# EAGLE design SmartTraffic_Shield_UNO_R3_Baquelita (EAGLE 9.3.1)
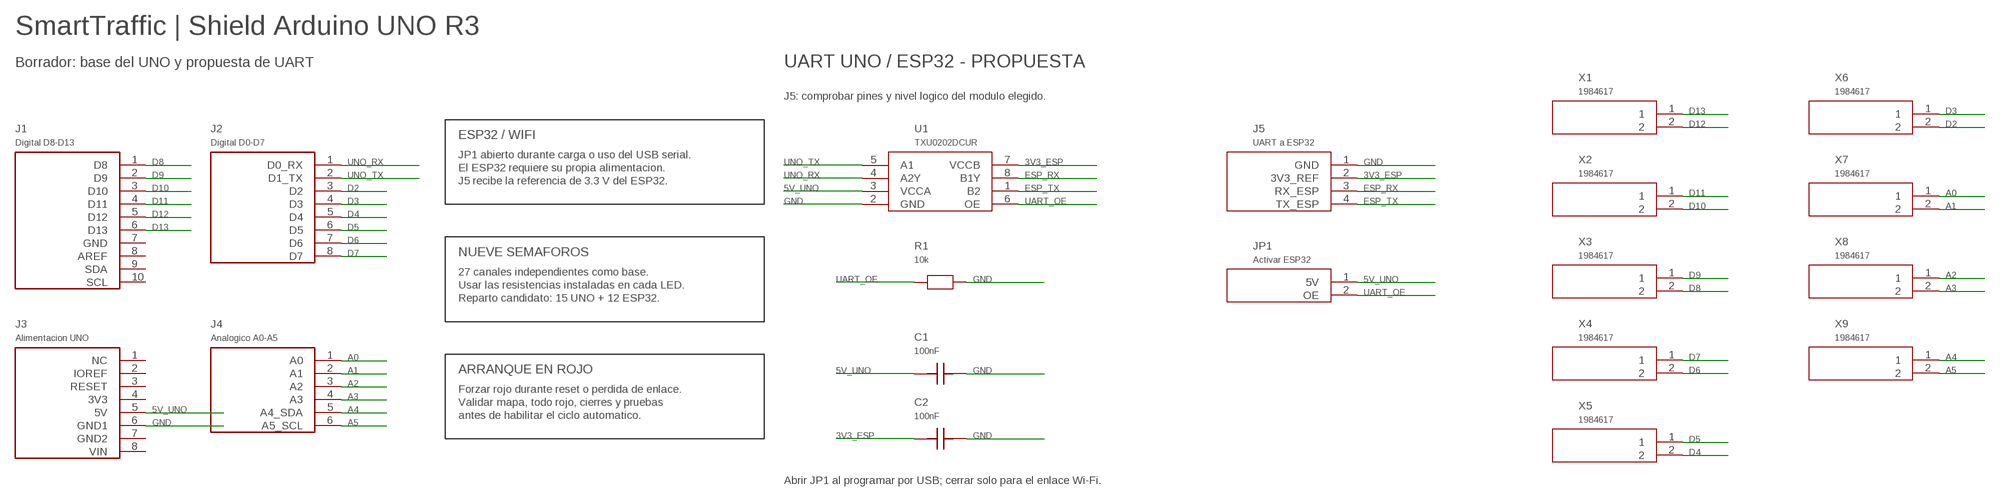
[diagram p0: schematic, sheet 1]

## Parts
C1  100nF  UART_BYPASS_5V  [CAPACITOR_RADIAL_5_08MM]
C2  100nF  UART_BYPASS_3V3  [CAPACITOR_RADIAL_5_08MM]
J1  Digital D8-D13  UNO_IOH  [SHIELD_1X10_P2.54]
J2  Digital D0-D7  UNO_IOL  [SHIELD_1X08_P2.54]
J3  Alimentacion UNO  UNO_POWER  [SHIELD_1X08_P2.54]
J4  Analogico A0-A5  UNO_AD  [SHIELD_1X06_P2.54]
J5  UART a ESP32  ESP32_UART  [SHIELD_1X04_P2.54]
JP1  Activar ESP32  UART_ENABLE  [SHIELD_1X02_P2.54]
R1  10k  UART_OE_PULLDOWN  [RESISTENCIA_AXIAL_7_62MM]
U1  TXU0202DCUR  UART_TXU0202  [TXU0202_ADAPTADOR_DIP8_300MIL]
X1  1984617  BORNERA_2  [PT_1_5_2_3_5_H]
X2  1984617  BORNERA_2  [PT_1_5_2_3_5_H]
X3  1984617  BORNERA_2  [PT_1_5_2_3_5_H]
X4  1984617  BORNERA_2  [PT_1_5_2_3_5_H]
X5  1984617  BORNERA_2  [PT_1_5_2_3_5_H]
X6  1984617  BORNERA_2  [PT_1_5_2_3_5_H]
X7  1984617  BORNERA_2SUR  [PT_1_5_2_3_5_H_SUR]
X8  1984617  BORNERA_2SUR  [PT_1_5_2_3_5_H_SUR]
X9  1984617  BORNERA_2SUR  [PT_1_5_2_3_5_H_SUR]

## Nets
3V3_ESP: C2.1 J5.2(3V3_REF) U1.7(VCCB)
5V_UNO: C1.1 J3.5(5V) JP1.1(5V) U1.3(VCCA)
A0: J4.1(A0) X7.1
A1: J4.2(A1) X7.2
A2: J4.3(A2) X8.1
A3: J4.4(A3) X8.2
A4: J4.5(A4_SDA) X9.1
A5: J4.6(A5_SCL) X9.2
D2: J2.3(D2) X6.2
D3: J2.4(D3) X6.1
D4: J2.5(D4) X5.2
D5: J2.6(D5) X5.1
D6: J2.7(D6) X4.2
D7: J2.8(D7) X4.1
D8: J1.1(D8) X3.2
D9: J1.2(D9) X3.1
D10: J1.3(D10) X2.2
D11: J1.4(D11) X2.1
D12: J1.5(D12) X1.2
D13: J1.6(D13) X1.1
ESP_RX: J5.3(RX_ESP) U1.8(B1Y)
ESP_TX: J5.4(TX_ESP) U1.1(B2)
GND: C1.2 C2.2 J3.6(GND1) J5.1(GND) R1.2 U1.2(GND)
UART_OE: JP1.2(OE) R1.1 U1.6(OE)
UNO_RX: J2.1(D0_RX) U1.4(A2Y)
UNO_TX: J2.2(D1_TX) U1.5(A1)
Unconnected: J1.7(GND) J1.8(AREF) J1.9(SDA) J1.10(SCL) J3.1(NC) J3.2(IOREF) J3.3(RESET) J3.4(3V3) J3.7(GND2) J3.8(VIN)

## Notes on the sheet
- SmartTraffic | Shield Arduino UNO R3
- Borrador: base del UNO y propuesta de UART | UART UNO / ESP32 - PROPUESTA
- J5: comprobar pines y nivel logico del modulo elegido.
- ESP32 / WIFI
- JP1 abierto durante carga o uso del USB serial.
- El ESP32 requiere su propia alimentacion.
- J5 recibe la referencia de 3.3 V del ESP32.
- NUEVE SEMAFOROS
- 27 canales independientes como base.
- Usar las resistencias instaladas en cada LED.
- Reparto candidato: 15 UNO + 12 ESP32.
- ARRANQUE EN ROJO
- Forzar rojo durante reset o perdida de enlace.
- Validar mapa, todo rojo, cierres y pruebas
- antes de habilitar el ciclo automatico.
- Abrir JP1 al programar por USB; cerrar solo para el enlace Wi-Fi.

## Library data of the parts
C1 = SmartTraffic_Shield:UART_BYPASS_5V
C2 = SmartTraffic_Shield:UART_BYPASS_3V3
J1 = SmartTraffic_Shield:UNO_IOH
J2 = SmartTraffic_Shield:UNO_IOL
J3 = SmartTraffic_Shield:UNO_POWER
J4 = SmartTraffic_Shield:UNO_AD
J5 = SmartTraffic_Shield:ESP32_UART
JP1 = SmartTraffic_Shield:UART_ENABLE
R1 = SmartTraffic_Shield:UART_OE_PULLDOWN
U1 = SmartTraffic_Shield:UART_TXU0202
X1-X9 = SmartTraffic_Shield:BORNERA_2

## Net classes
0 default: width 0.254 mm, clearance 0.254 mm
1 power: width 0.61 mm, drill 0.61 mm, clearance 0.254 mm
2 gnd: width 0.305 mm, drill 0.559 mm, clearance 0.254 mm
3 usbvcc: width 0.508 mm, drill 0.61 mm, clearance 0.254 mm
4 aref: width 0.406 mm, drill 0.61 mm, clearance 0.254 mm

## Board
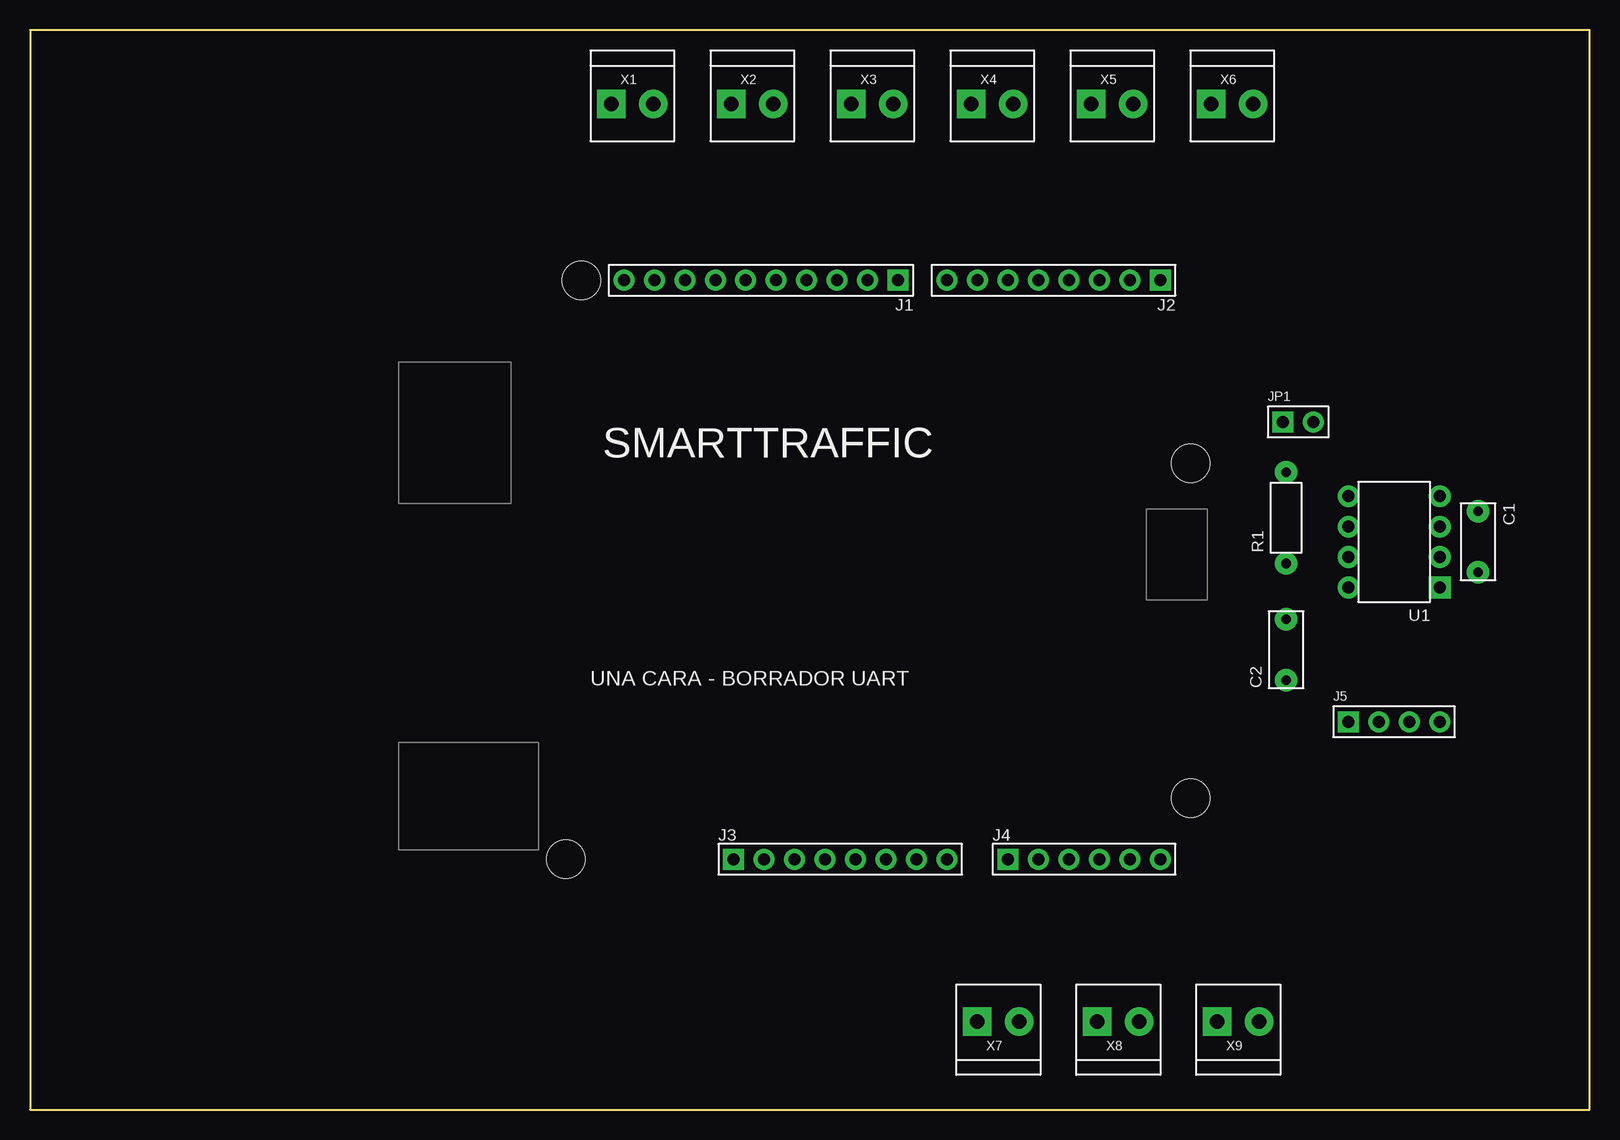
[diagram p1: board, top side]
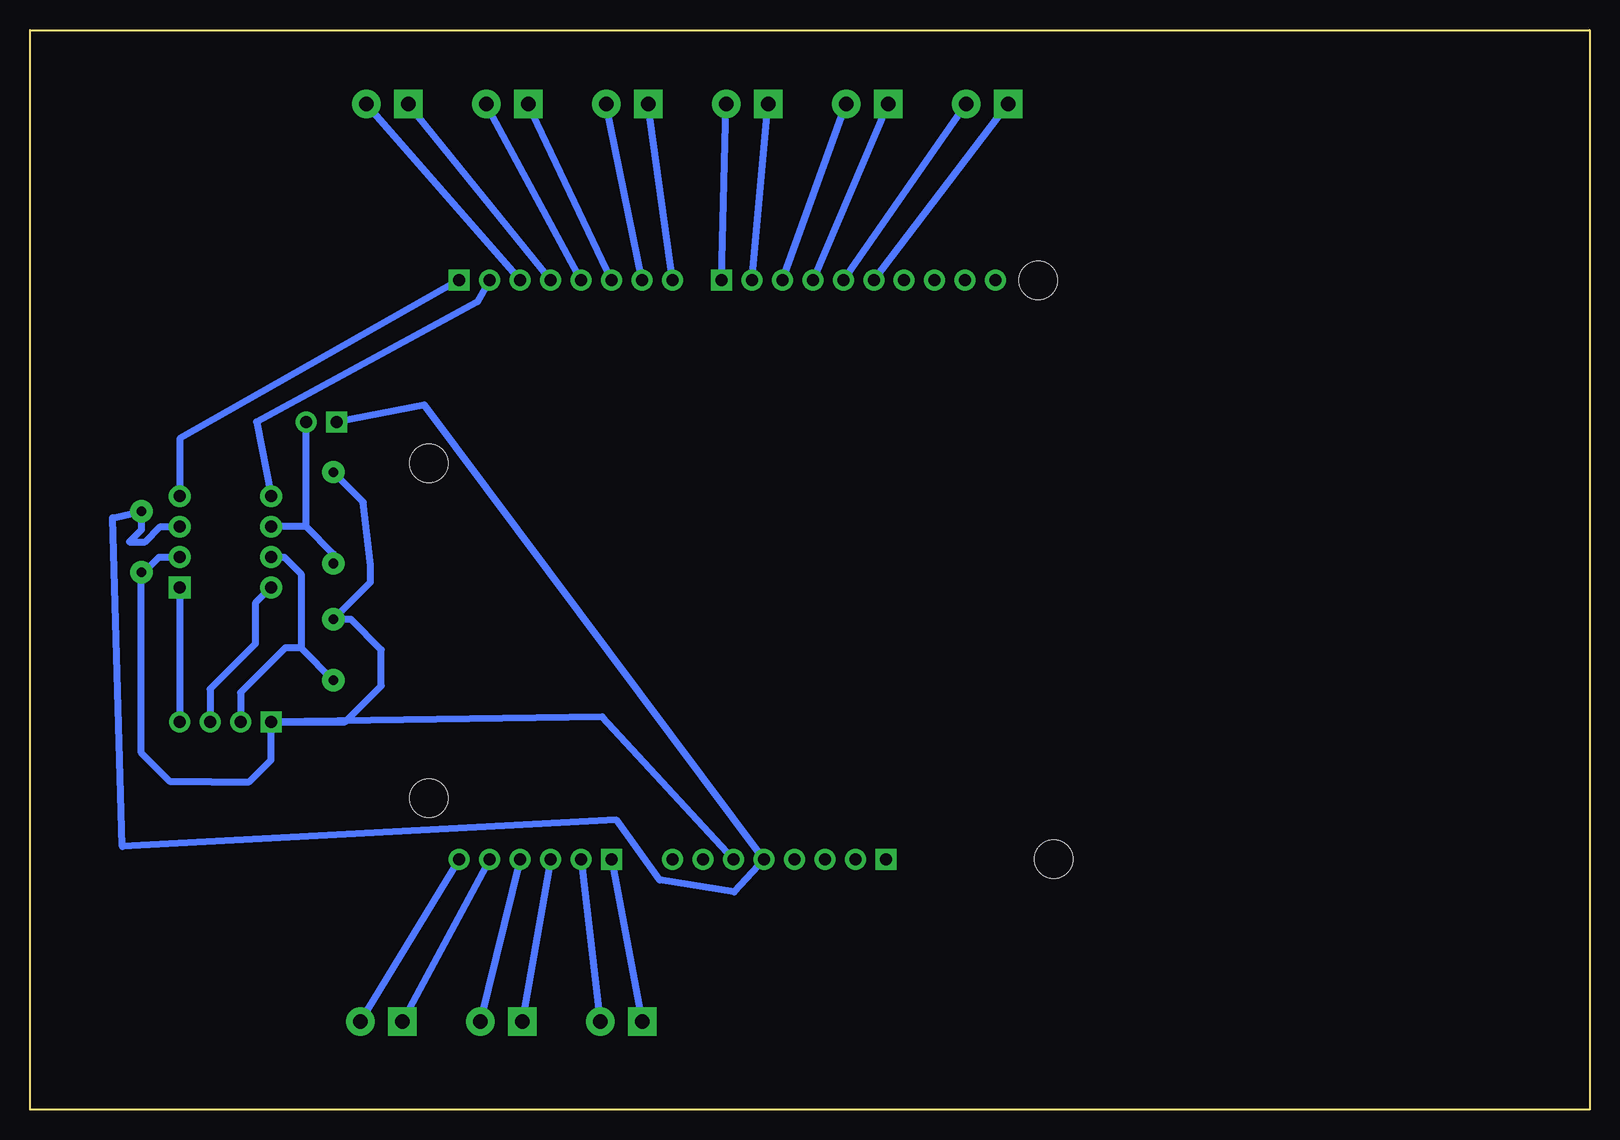
[diagram p2: board, bottom side, seen from below]

Size 130 x 90 mm. Coordinates in mm from the lower left corner, seen from the top.
Outline: 0,0 130,0 130,90 0,90 0,0
Copper layers (1*16): Top 0.035mm / dielectric 1.5mm / Bottom 0.035mm
Design rules "SmartTraffic_UnaCara": minimum track width 0.60mm, minimum drill 12mil, track to track 0.6mm, track to pad 0.6mm, pad to pad 0.6mm, via to via 6mil, smd to smd 0.6mm, copper to edge 0.45mm, drill to drill 12mil, minimum pad ring 10mil, minimum via ring 6mil, stop-mask expansion 1mil, vias tented up to drill 30mil, thermal gap 10mil
Holes 3.2 mm at 96.75,53.89 96.75,25.95 45.95,69.13 44.68,20.87

### Footprints (pad centres in the part's own frame; a part is rotated, then mirrored left to right if it is on the bottom)
CAPACITOR_RADIAL_5_08MM = drill 0.8 pad 1.85 round: 1 -2.54,0; 2 2.54,0
SHIELD_1X10_P2.54 = drill 1 pad 1.75 square: 1 -11.43,0 | drill 1 pad 1.75 round: 2 -8.89,0; 3 -6.35,0; 4 -3.81,0; 5 -1.27,0; 6 1.27,0; 7 3.81,0; 8 6.35,0; 9 8.89,0; 10 11.43,0
SHIELD_1X08_P2.54 = drill 1 pad 1.75 square: 1 -8.89,0 | drill 1 pad 1.75 round: 2 -6.35,0; 3 -3.81,0; 4 -1.27,0; 5 1.27,0; 6 3.81,0; 7 6.35,0; 8 8.89,0
SHIELD_1X06_P2.54 = drill 1 pad 1.75 square: 1 -6.35,0 | drill 1 pad 1.75 round: 2 -3.81,0; 3 -1.27,0; 4 1.27,0; 5 3.81,0; 6 6.35,0
SHIELD_1X04_P2.54 = drill 1 pad 1.75 square: 1 -3.81,0 | drill 1 pad 1.75 round: 2 -1.27,0; 3 1.27,0; 4 3.81,0
SHIELD_1X02_P2.54 = drill 1 pad 1.75 square: 1 -1.27,0 | drill 1 pad 1.75 round: 2 1.27,0
RESISTENCIA_AXIAL_7_62MM = drill 0.8 pad 1.85 round: 1 -3.81,0; 2 3.81,0
TXU0202_ADAPTADOR_DIP8_300MIL = drill 1 pad 1.8 square: 1 -3.81,3.81 | drill 1 pad 1.8 round: 2 -3.81,1.27; 3 -3.81,-1.27; 4 -3.81,-3.81; 5 3.81,-3.81; 6 3.81,-1.27; 7 3.81,1.27; 8 3.81,3.81
PT_1_5_2_3_5_H = drill 1.2 pad 2.4 square: 1 -1.75,0 | drill 1.2 pad 2.4 round: 2 1.75,0
PT_1_5_2_3_5_H_SUR = drill 1.2 pad 2.4 square: 1 -1.75,0 | drill 1.2 pad 2.4 round: 2 1.75,0

### Placement (x,y rotation side)
C1  120.71,47.33 270 top
C2  104.71,38.33 90 top
J1  60.94,69.13 180 top
J2  85.32,69.13 180 top
J3  67.54,20.87 0 top
J4  87.86,20.87 0 top
J5  113.71,32.33 0 top
JP1  105.71,57.33 0 top
R1  104.71,49.33 90 top
U1  TXU0202DCUR + adaptador DIP-8  [TXU0202_ADAPTADOR_DIP8_300MIL]  113.71,47.33 180 top
X1  50.21,83.83 0 top
X2  60.21,83.83 0 top
X3  70.21,83.83 0 top
X4  80.21,83.83 0 top
X5  90.21,83.83 0 top
X6  100.21,83.83 0 top
X7  80.71,7.33 0 top
X8  90.71,7.33 0 top
X9  100.71,7.33 0 top

### Tracks (layer width: path | path; a pad name or v marks a point on that pad's centre or on a via)
3V3_ESP
  Bottom 0.6: U1.7 108.81,46.06 107.41,44.66 107.41,38.49 | 107.41,38.49 C2.1 | 107.41,38.49 108.71,38.49 112.44,34.76 J5.2
5V_UNO
  Bottom 0.6: U1.3 119.14,48.6 120.41,47.33 121.71,47.33 120.71,48.33 C1.1 123.11,49.33 122.31,21.93 81.11,24.13 77.51,19.13 71.31,18.13 J3.5 97.11,58.73 JP1.1
A0
  Bottom 0.6: J4.1 X7.1
A1
  Bottom 0.6: J4.2 X7.2
A2
  Bottom 0.6: J4.3 X8.1
A3
  Bottom 0.6: J4.4 X8.2
A4
  Bottom 0.6: J4.5 X9.1
A5
  Bottom 0.6: J4.6 X9.2
D2
  Bottom 0.6: J2.3 X6.2
D3
  Bottom 0.6: J2.4 X6.1
D4
  Bottom 0.6: J2.5 X5.2
D5
  Bottom 0.6: J2.6 X5.1
D6
  Bottom 0.6: J2.7 X4.2
D7
  Bottom 0.6: J2.8 X4.1
D8
  Bottom 0.6: J1.1 X3.2
D9
  Bottom 0.6: J1.2 X3.1
D10
  Bottom 0.6: J1.3 X2.2
D11
  Bottom 0.6: J1.4 X2.1
D12
  Bottom 0.6: J1.5 X1.2
D13
  Bottom 0.6: J1.6 X1.1
ESP_RX
  Bottom 0.6: U1.8 111.21,42.21 111.21,38.83 114.98,35.06 J5.3
ESP_TX
  Bottom 0.6: U1.1 J5.4
GND
  Bottom 0.6: J5.1 109.9,29.14 111.71,27.33 114.9,27.33 118.31,27.33 120.71,29.73 C1.2 120.51,44.79 119.24,46.06 U1.2 | J5.1 103.71,32.33 100.71,35.33 100.71,38.33 103.25,40.87 C2.2 101.61,43.97 101.61,45.37 102.21,50.64 R1.2 | J3.6 82.31,32.73 J5.1
UART_OE
  Bottom 0.6: R1.1 104.71,46.33 106.98,48.6 | 106.98,48.6 U1.6 | 106.98,48.6 JP1.2
UNO_RX
  Bottom 0.6: J2.1 117.51,55.93 U1.4
UNO_TX
  Bottom 0.6: J2.2 92.71,67.33 111.11,57.33 U1.5

### Text on the board
tPlace: SMARTTRAFFIC | UNA CARA - BORRADOR UART
tDocu: USB-B | ICSP | Jack DC